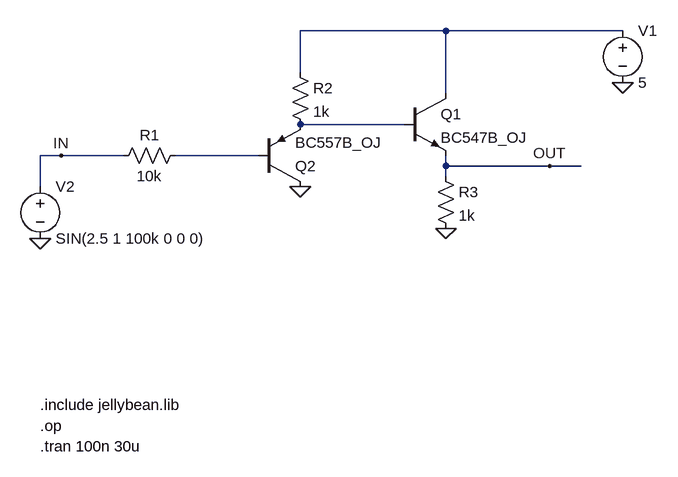
[diagram p0: schematic bjt_emitter_follower.asc]
bjt_emitter_follower.asc, the LTspice schematic file:
Version 4.1
SHEET 1 2400 1600
WIRE 624 -224 400 -224
WIRE 896 -224 624 -224
WIRE 400 -160 400 -224
WIRE 624 -128 624 -224
WIRE 560 -80 400 -80
WIRE 32 -32 0 -32
WIRE 128 -32 32 -32
WIRE 336 -32 208 -32
WIRE 624 -16 624 -32
WIRE 784 -16 624 -16
WIRE 832 -16 784 -16
WIRE 624 0 624 -16
WIRE 0 16 0 -32
FLAG 0 96 0
FLAG 896 -144 0
FLAG 32 -32 IN
FLAG 400 16 0
FLAG 624 80 0
FLAG 784 -16 OUT
SYMBOL voltage 0 0 R0
SYMATTR InstName V2
SYMATTR Value SIN(2.5 1 100k 0 0 0)
SYMATTR Value2 AC 1
SYMBOL res 224 -48 R90
WINDOW 0 0 56 VBottom 2
WINDOW 3 32 56 VTop 2
SYMATTR InstName R1
SYMATTR Value 10k
SYMBOL voltage 896 -240 R0
SYMATTR InstName V1
SYMATTR Value 5
SYMBOL res 384 -176 R0
SYMATTR InstName R2
SYMATTR Value 1k
SYMBOL pnp 336 16 M180
SYMATTR InstName Q2
SYMATTR Value BC557B_OJ
SYMBOL npn 560 -128 R0
SYMATTR InstName Q1
SYMATTR Value BC547B_OJ
SYMBOL res 608 -16 R0
SYMATTR InstName R3
SYMATTR Value 1k
TEXT 0 352 Left 2 !.include jellybean.lib
TEXT 0 384 Left 2 !.op
TEXT 0 416 Left 2 !.tran 100n 30u

The netlist it stands for:
* bjt_emitter_follower.asc
V2 IN 0 SIN(2.5 1 100k 0 0 0) AC 1
R1 N003 IN 10k
V1 N001 0 5
R2 N001 N002 1k
Q2 0 N003 N002 0 BC557B_OJ
Q1 N001 N002 OUT 0 BC547B_OJ
R3 OUT 0 1k
.model NPN NPN
.model PNP PNP
.lib standard.bjt
.include jellybean.lib
.op
.tran 100n 30u
.backanno
.end